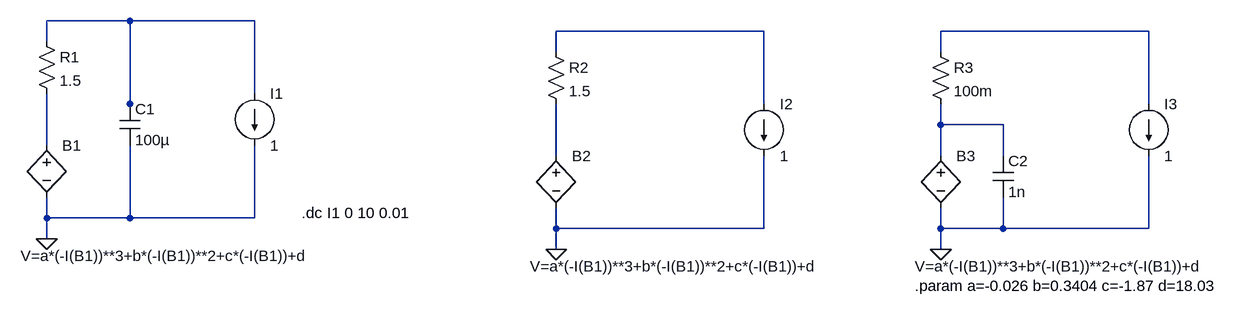
[diagram p0: schematic test2.asc]
test2.asc, the LTspice schematic file:
Version 4.1
SHEET 1 4760 680
WIRE -128 -112 -256 -112
WIRE 64 -112 -128 -112
WIRE 848 -96 528 -96
WIRE 1440 -96 1120 -96
WIRE -256 -80 -256 -112
WIRE 528 -64 528 -96
WIRE 1120 -64 1120 -96
WIRE 64 0 64 -112
WIRE -128 16 -128 -112
WIRE 848 16 848 -96
WIRE 1440 16 1440 -96
WIRE -128 32 -128 16
WIRE 1120 48 1120 16
WIRE 1216 48 1120 48
WIRE -256 80 -256 0
WIRE 528 96 528 16
WIRE 1120 96 1120 48
WIRE 1216 96 1216 48
WIRE -256 192 -256 160
WIRE -128 192 -128 80
WIRE -128 192 -256 192
WIRE 64 192 64 80
WIRE 64 192 -128 192
WIRE 528 208 528 176
WIRE 848 208 848 96
WIRE 848 208 528 208
WIRE 1120 208 1120 176
WIRE 1216 208 1216 160
WIRE 1216 208 1120 208
WIRE 1440 208 1440 96
WIRE 1440 208 1216 208
WIRE -256 224 -256 192
WIRE 528 240 528 208
WIRE 1120 240 1120 208
FLAG -256 224 0
FLAG 528 240 0
FLAG 1120 240 0
SYMBOL bv -256 64 R0
WINDOW 3 -40 186 Left 2
SYMATTR Value V=a*(-I(B1))**3+b*(-I(B1))**2+c*(-I(B1))+d
SYMATTR InstName B1
SYMBOL res -272 -96 R0
SYMATTR InstName R1
SYMATTR Value 1.5
SYMBOL cap -144 16 R0
SYMATTR InstName C1
SYMATTR Value 100µ
SYMBOL current 64 0 R0
WINDOW 123 0 0 Left 0
WINDOW 39 0 0 Left 0
SYMATTR InstName I1
SYMATTR Value 1
SYMBOL bv 528 80 R0
WINDOW 3 -40 186 Left 2
SYMATTR Value V=a*(-I(B1))**3+b*(-I(B1))**2+c*(-I(B1))+d
SYMATTR InstName B2
SYMBOL res 512 -80 R0
SYMATTR InstName R2
SYMATTR Value 1.5
SYMBOL current 848 16 R0
WINDOW 123 0 0 Left 0
WINDOW 39 0 0 Left 0
SYMATTR InstName I2
SYMATTR Value 1
SYMBOL bv 1120 80 R0
WINDOW 3 -40 186 Left 2
SYMATTR Value V=a*(-I(B1))**3+b*(-I(B1))**2+c*(-I(B1))+d
SYMATTR InstName B3
SYMBOL res 1104 -80 R0
SYMATTR InstName R3
SYMATTR Value 100m
SYMBOL current 1440 16 R0
WINDOW 123 0 0 Left 0
WINDOW 39 0 0 Left 0
SYMATTR InstName I3
SYMATTR Value 1
SYMBOL cap 1200 96 R0
SYMATTR InstName C2
SYMATTR Value 1n
TEXT 1080 296 Left 2 !.param a=-0.026 b=0.3404 c=-1.87 d=18.03
TEXT 136 184 Left 2 !.dc I1 0 10 0.01

The netlist it stands for:
* test2.asc
B1 N005 0 V=a*(-I(B1))**3+b*(-I(B1))**2+c*(-I(B1))+d
R1 N001 N005 1.5
C1 N001 0 100µ
I1 N001 0 1
B2 N006 0 V=a*(-I(B1))**3+b*(-I(B1))**2+c*(-I(B1))+d
R2 N002 N006 1.5
I2 N002 0 1
B3 N004 0 V=a*(-I(B1))**3+b*(-I(B1))**2+c*(-I(B1))+d
R3 N003 N004 100m
I3 N003 0 1
C2 N004 0 1n
.param a=-0.026 b=0.3404 c=-1.87 d=18.03
.dc I1 0 10 0.01
.backanno
.end